# Altium schematic sheet ARGB LEDs.SchDoc
size A; SheetNumber: 5; SheetTotal: 6
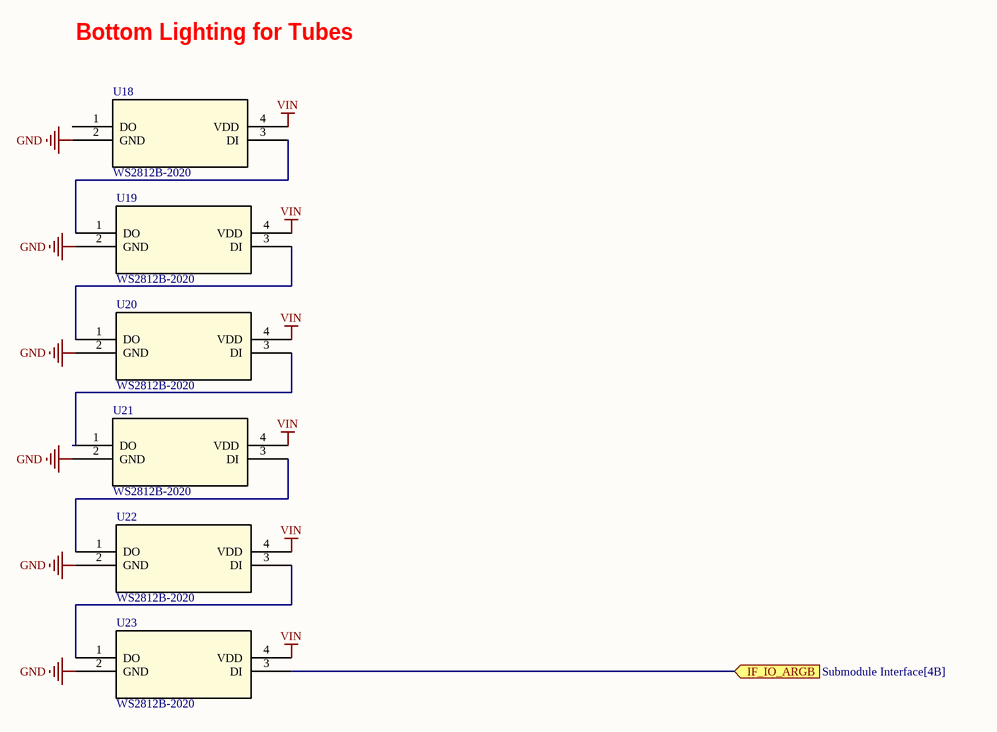
[diagram p0: ARGB LEDs.SchDoc]

## Parts
U18  WS2812B-2020  [SMT_12B-2020_WDS]
U19  WS2812B-2020  [SMT_12B-2020_WDS]
U20  WS2812B-2020  [SMT_12B-2020_WDS]
U21  WS2812B-2020  [SMT_12B-2020_WDS]
U22  WS2812B-2020  [SMT_12B-2020_WDS]
U23  WS2812B-2020  [SMT_12B-2020_WDS]

## Ports
IF_IO_ARGB (in, see Submodule Interface[4B])

## Nets
GND: U18.2(GND) U19.2(GND) U20.2(GND) U21.2(GND) U22.2(GND) U23.2(GND)
VIN: U18.4(VDD) U19.4(VDD) U20.4(VDD) U21.4(VDD) U22.4(VDD) U23.4(VDD)
IF_IO_ARGB: U23.3(DI) ; port IF_IO_ARGB
NetU18_3: U18.3(DI) U19.1(DO)
NetU19_3: U19.3(DI) U20.1(DO)
NetU20_3: U20.3(DI) U21.1(DO)
NetU21_3: U21.3(DI) U22.1(DO)
NetU22_3: U22.3(DI) U23.1(DO)

Not connected (* = marked no-connect by the designer): U18 1(DO)

## Notes on the sheet
- Bottom Lighting for Tubes

## Library data of the parts
U18-U23 = WS2812B-2020: No Description Available; Mfr_Name: Worldsemi; RefDes: RefDes; Type: Type